# Altium schematic sheet 4.ble.SchDoc
size A4; DocumentNumber: 5; SheetNumber: 5; SheetTotal: 8; Page: Ble_module
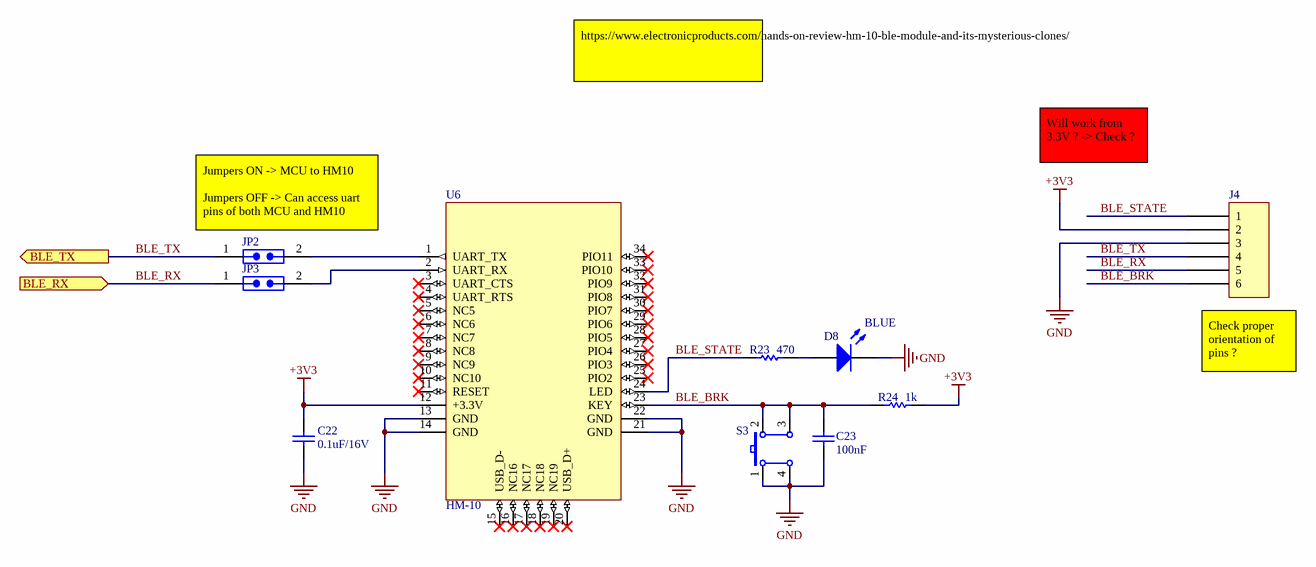
[diagram p0: 4.ble.SchDoc]

## Parts
C22  0.1uF/16V  [cap0603]
C23  100nF  [cap0603]
D8  BLUE  [LED0603]
J4  (no value)  [HEADER_FEMALE_6POS_P2.54MM]
JP2  (no value)
JP3  (no value)
R23  470  [RES0402]
R24  1k  [RES0402]
S3  (no value)
U6  HM-10  [26.9X13X2.2_BOARD]

## Ports
BLE_RX (in), BLE_TX (out)

## Nets
+3V3: C22.2 J4.2 R24.2 U6.12(+3.3V)
GND: C22.1 C23.2 D8.2(K) J4.3 S3.1 S3.4 U6.13(GND) U6.14(GND) U6.21(GND) U6.22(GND)
BLE_BRK: C23.1 J4.6 R24.1 S3.2 S3.3 U6.23(KEY)
BLE_RX: J4.5 JP3.1 ; port BLE_RX
BLE_STATE: J4.1 R23.1 U6.24(LED)
BLE_TX: J4.4 JP2.1 ; port BLE_TX
NetD8_1: D8.1(A) R23.2
NetJP2_2: JP2.2 U6.1(UART_TX)
NetJP3_2: JP3.2 U6.2(UART_RX)

Not connected (* = marked no-connect by the designer): U6 3(UART_CTS)* 4(UART_RTS)* 5(NC5)* 6(NC6)* 7(NC7)* 8(NC8)* 9(NC9)* 10(NC10)* 11(RESET)* 15(USB_D-)* 16(NC16)* 17(NC17)* 18(NC18)* 19(NC19)* 20(USB_D+)* 25(PIO2)* 26(PIO3)* 27(PIO4)* 28(PIO5)* 29(PIO6)* 30(PIO7)* 31(PIO8)* 32(PIO9)* 33(PIO10)* 34(PIO11)*

## Notes on the sheet
- https://www.electronicproducts.com/hands-on-review-hm-10-ble-module-and-its-mysterious-clones/
- Will work from 3.3V ? -> Check ?
- (near JP2) Jumpers ON -> MCU to HM10
  Jumpers OFF -> Can access uart pins of both MCU and HM10
- (near J4) Check proper orientation of pins ?
- Title :
- Size:
- Date:
- Page :
- A4
- Number:
- Time:
- Revision:
- Sheet
- of
- Sheet Name :
- Drawn By :

## Library data of the parts
C22 = Cap: Capacitor; Voltage Rating: 16V; MF: *; MP: *; JLCPCB: *
C23 = Cap: Capacitor; MF: *; MP: *; JLCPCB: *
D8 = LED: Light Emitting Diode; Manufacturer: *; Manufacturer part number: *; JLCPCB part number: *
J4 = 6 Pin: CONN RCPT 6POS 0.1 GOLD PCB; Part Number: M20-7820642; Manufacturer: Harwin Inc.; Connector Type: Receptacle; Contact Length - Post: 0.118" (3.00mm); Current Rating (Amps): 3A; Mated Stacking Heights: 11.04mm, 12.63mm; Material Flammability Rating: UL94 V-0; Number of Positions: 6; Number of Positions Loaded: All; Pitch - Mating: 0.100" (2.54mm); Style: Board to Board or Cable; ComponentLink1Description: Datasheet; ComponentLink1URL: https://cdn.harwin.com/pdfs/C001XX_M20_Series_Connectors.pdf; ComponentLink2Description: DigiKey Link; ComponentLink2URL: https://www.digikey.com/en/products/detail/harwin-inc/M20-7820642/3727776; Contact Finish - Mating: Gold; Contact Finish - Post: Tin; Contact Finish Thickness - Mating: Flash; Contact Type: Female Socket; Fastening Type: Push-Pull; Insulation Color: Black; Insulation Height: 0.335" (8.51mm); LastUpdated: 9/21/2022 6:58:09 PM; Lifecycle Status: Active; Minimum Order: 1; Mounting Type: Through Hole; Number of Rows: 1; Operating Temperature: -40°C ~ 105°C; Packaging: Tube; Part Status: Active; Price: 0.55; Series: M20; Supplier 1: DigiKey; Supplier Part Number 1: 952-1808-ND; Termination: Solder
JP2 JP3 = 2 Pin Jumper_Series: 2 Pin Jumper - place in series with wires.; Part Number: NC6-P108-03; Manufacturer: TE Connectivity AMP Connectors; Barrier Type: 2 Wall (Dual); Bottom Termination: PC Pin; Current Rating (Amps): 20A; Number of Circuits: 3; Pitch: 0.375" (9.53mm); Top Termination: Screws with Captive Plate; Voltage Rating: 300V; Wire Gauge: 12-22 AWG; Color: Black; ComponentLink1Description: Datasheet; ComponentLink1URL: https://www.te.com/commerce/DocumentDelivery/DDEController?Action=srchrtrv&DocNm=3-1437664-0&DocType=Customer+Drawing&DocLang=English; ComponentLink2Description: DigiKey Link; ComponentLink2URL: http://digikey.com/product-detail/en/te-connectivity-amp-connectors/NC6-P108-03/A98496-ND/1277927; LastUpdated: 1/15/2020 4:12:05 AM; Lifecycle Status: Active; Minimum Order: 1; Number of Rows: 1; Number of Wire Entries: 3; Packaging: Bulk; Part Status: Active; Price: 2.16; Series: NC6, Buchanan; Supplier 1: DigiKey; Supplier Part Number 1: A98496-ND; Terminal Block Type: Barrier Block
R23 R24 = Res: Resistor; Manufacturer: *; Manufacturer part number: *; JLCPCB part number: *
S3 = SPST-NO 4 PIN: Switch Push button
U6 = HM-10: Bluetooth 4.0 module with 4pin base board that can support iphone4s or later.; MF: Jinan Huamao Technology; SnapEDA_Link: https://www.snapeda.com/parts/HM-10/Jinan+Huamao+Technology/view-part/?ref=snap; Package: Package; Value: *; MP: HM-10; Check_prices: https://www.snapeda.com/parts/HM-10/Jinan+Huamao+Technology/view-part/?ref=eda